# Altium schematic sheet Dahili Moduller 3.SchDoc
size A4; SheetNumber: 7; SheetTotal: 7
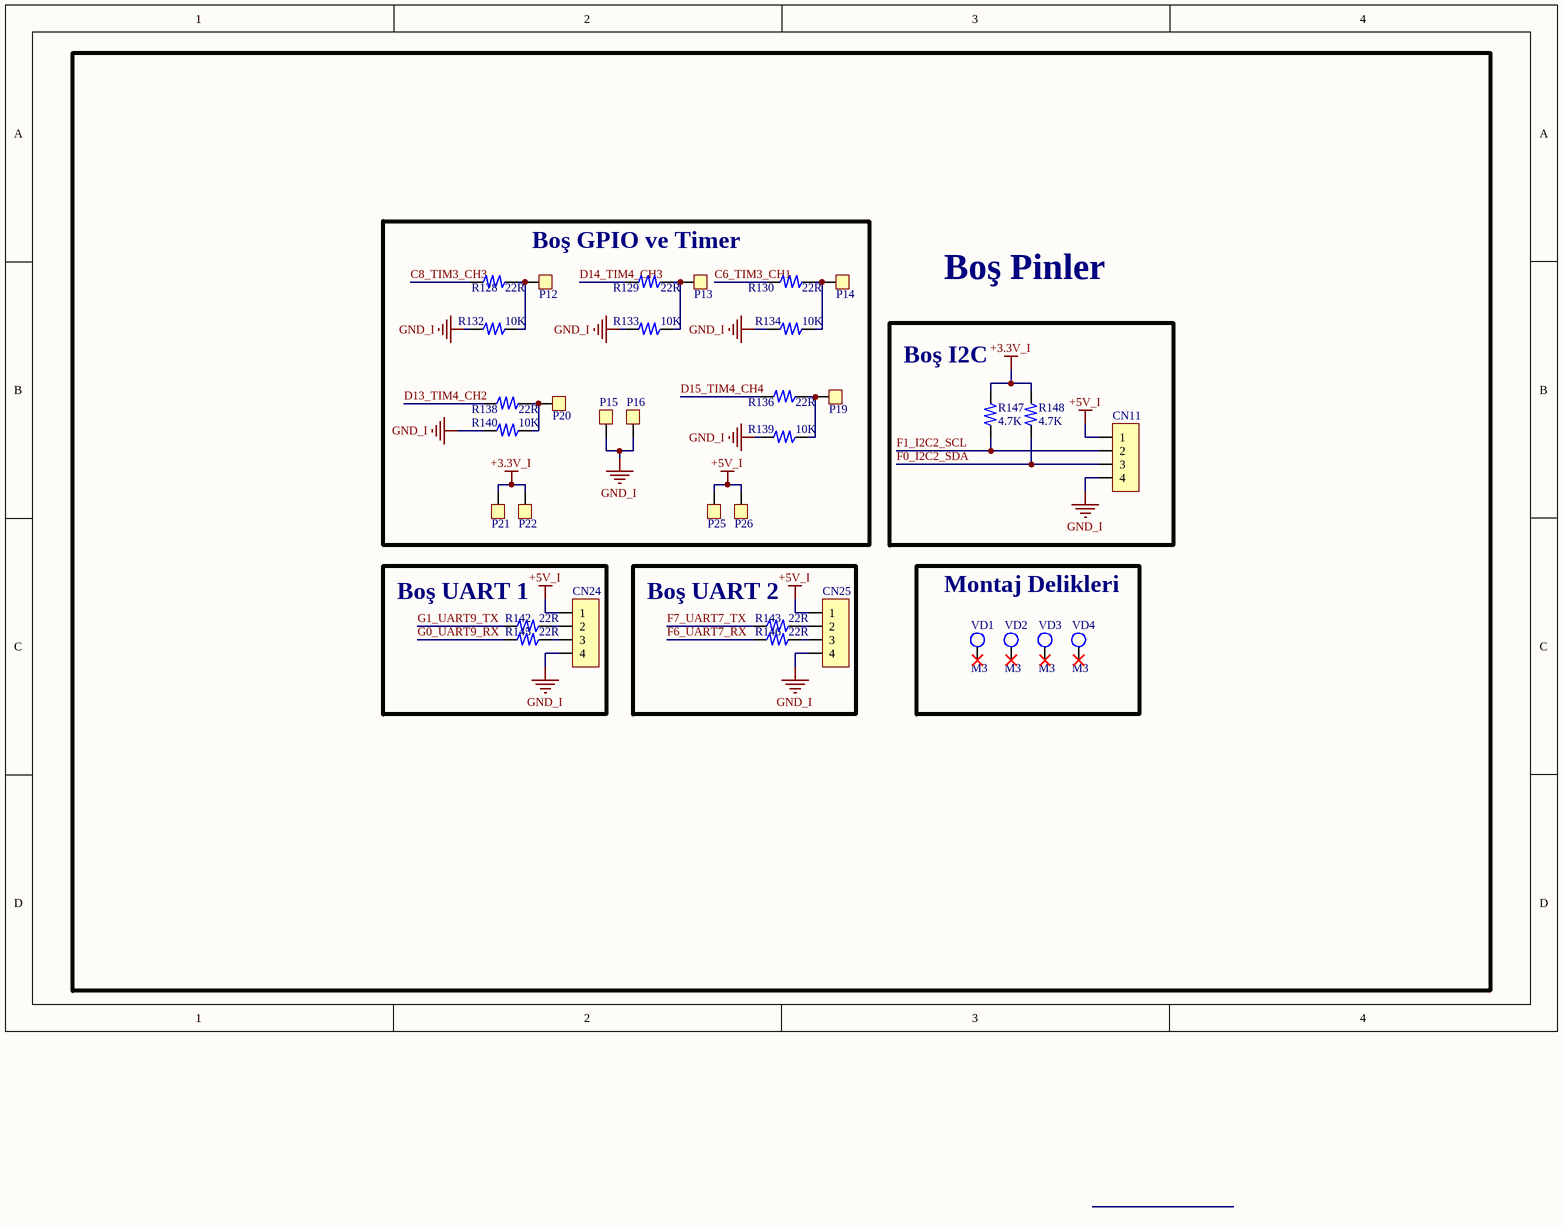
[diagram p0: Dahili Moduller 3.SchDoc]

## Parts
CN11  4_Pin_JST_Male  [4_Pin_JST_Male]  (value not drawn)
CN24  4_Pin_JST_Male  [4_Pin_JST_Male]  (value not drawn)
CN25  4_Pin_JST_Male  [4_Pin_JST_Male]  (value not drawn)
P12  ped  [ped]  (value not drawn)
P13  ped  [ped]  (value not drawn)
P14  ped  [ped]  (value not drawn)
P15  ped  [ped]  (value not drawn)
P16  ped  [ped]  (value not drawn)
P19  ped  [ped]  (value not drawn)
P20  ped  [ped]  (value not drawn)
P21  ped  [ped]  (value not drawn)
P22  ped  [ped]  (value not drawn)
P25  ped  [ped]  (value not drawn)
P26  ped  [ped]  (value not drawn)
R128  22R  [0805 Dırenc]
R129  22R  [0805 Dırenc]
R130  22R  [0805 Dırenc]
R132  10K  [0805 Dırenc]
R133  10K  [0805 Dırenc]
R134  10K  [0805 Dırenc]
R136  22R  [0805 Dırenc]
R138  22R  [0805 Dırenc]
R139  10K  [0805 Dırenc]
R140  10K  [0805 Dırenc]
R142  22R  [0805 Dırenc]
R143  22R  [0805 Dırenc]
R145  22R  [0805 Dırenc]
R146  22R  [0805 Dırenc]
R147  4.7K  [0805 Dırenc]
R148  4.7K  [0805 Dırenc]
VD1  M3  [Vida_Deliği]
VD2  M3  [Vida_Deliği]
VD3  M3  [Vida_Deliği]
VD4  M3  [Vida_Deliği]

## Blocks framed on the sheet
Boş GPIO ve Timer: P12-P16 P19-P22 P25 P26 R128-R130 R132-R134 R136 R138-R140
Boş I2C: CN11 R147 R148
Boş UART 1: CN24 R142 R145
Boş UART 2: CN25 R143 R146
Montaj Delikleri: VD1-VD4

## Nets
+3.3V_I: P21.1 P22.1 R147.2 R148.2
+5V_I: CN11.1 CN24.1 CN25.1 P25.1 P26.1
GND_I: CN11.4 CN24.4 CN25.4 P15.1 P16.1 R132.1 R133.1 R134.1 R139.1 R140.1
C6_TIM3_CH1: R130.1
C8_TIM3_CH3: R128.1
D13_TIM4_CH2: R138.1
D14_TIM4_CH3: R129.1
D15_TIM4_CH4: R136.1
F0_I2C2_SDA: CN11.3 R148.1
F1_I2C2_SCL: CN11.2 R147.1
F6_UART7_RX: R146.1
F7_UART7_TX: R143.1
G0_UART9_RX: R145.1
G1_UART9_TX: R142.1
NetCN24_2: CN24.2 R142.2
NetCN24_3: CN24.3 R145.2
NetCN25_2: CN25.2 R143.2
NetCN25_3: CN25.3 R146.2
NetP12_1: P12.1 R128.2 R132.2
NetP13_1: P13.1 R129.2 R133.2
NetP14_1: P14.1 R130.2 R134.2
NetP19_1: P19.1 R136.2 R139.2
NetP20_1: P20.1 R138.2 R140.2

Not connected (* = marked no-connect by the designer): VD1 1*; VD2 1*; VD3 1*; VD4 1*

## Notes on the sheet
- Boş Pinler

## Library data of the parts
R128-R130 R132-R134 R136 R138-R140 R142 R143 R145-R148 = Direnc 0805
VD1-VD4 = Vida_Deliği